# Altium schematic sheet SystemOnModule.SchDoc
size A2; CompanyName: KDS; Organization: KDS; DocumentNumber: 4; Revision: V1I1; SheetNumber: 0; SheetTotal: 10; PageSetup: Record=PageOptions|CenterHorizontal=True|CenterVertical=True|PrintScale=1.07|XCorrection=1.00|YCorrection=1.00|PrintKind=1|BorderSize=5000000|LeftOffset=0|BottomOffset=0|Orientation=2|PaperLength=1000|PaperWidth=1000|Scale=100|PaperSource=7|PrintQuality=600|MediaType=1|DitherType=10|PaperKind=A3|PrintScaleMode=1; ProjectName: KDS C6A816x Module
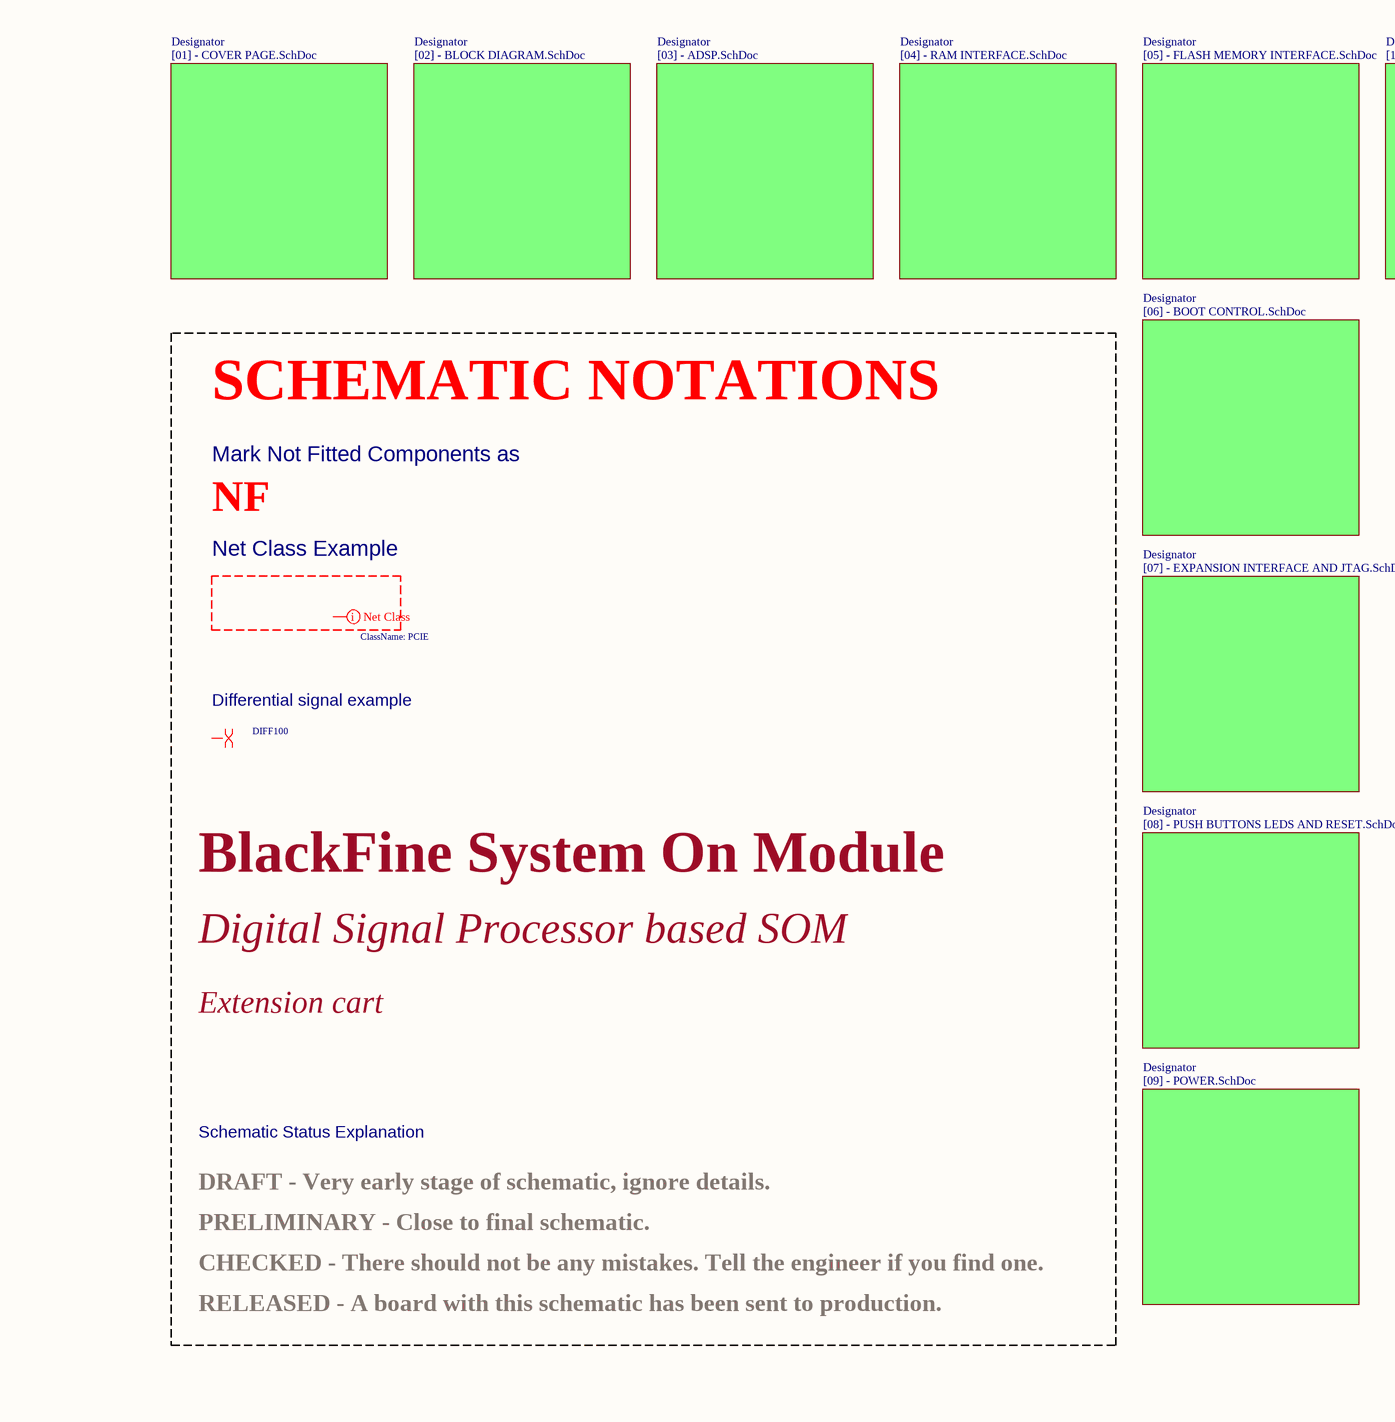
[diagram p0: SystemOnModule.SchDoc, left]
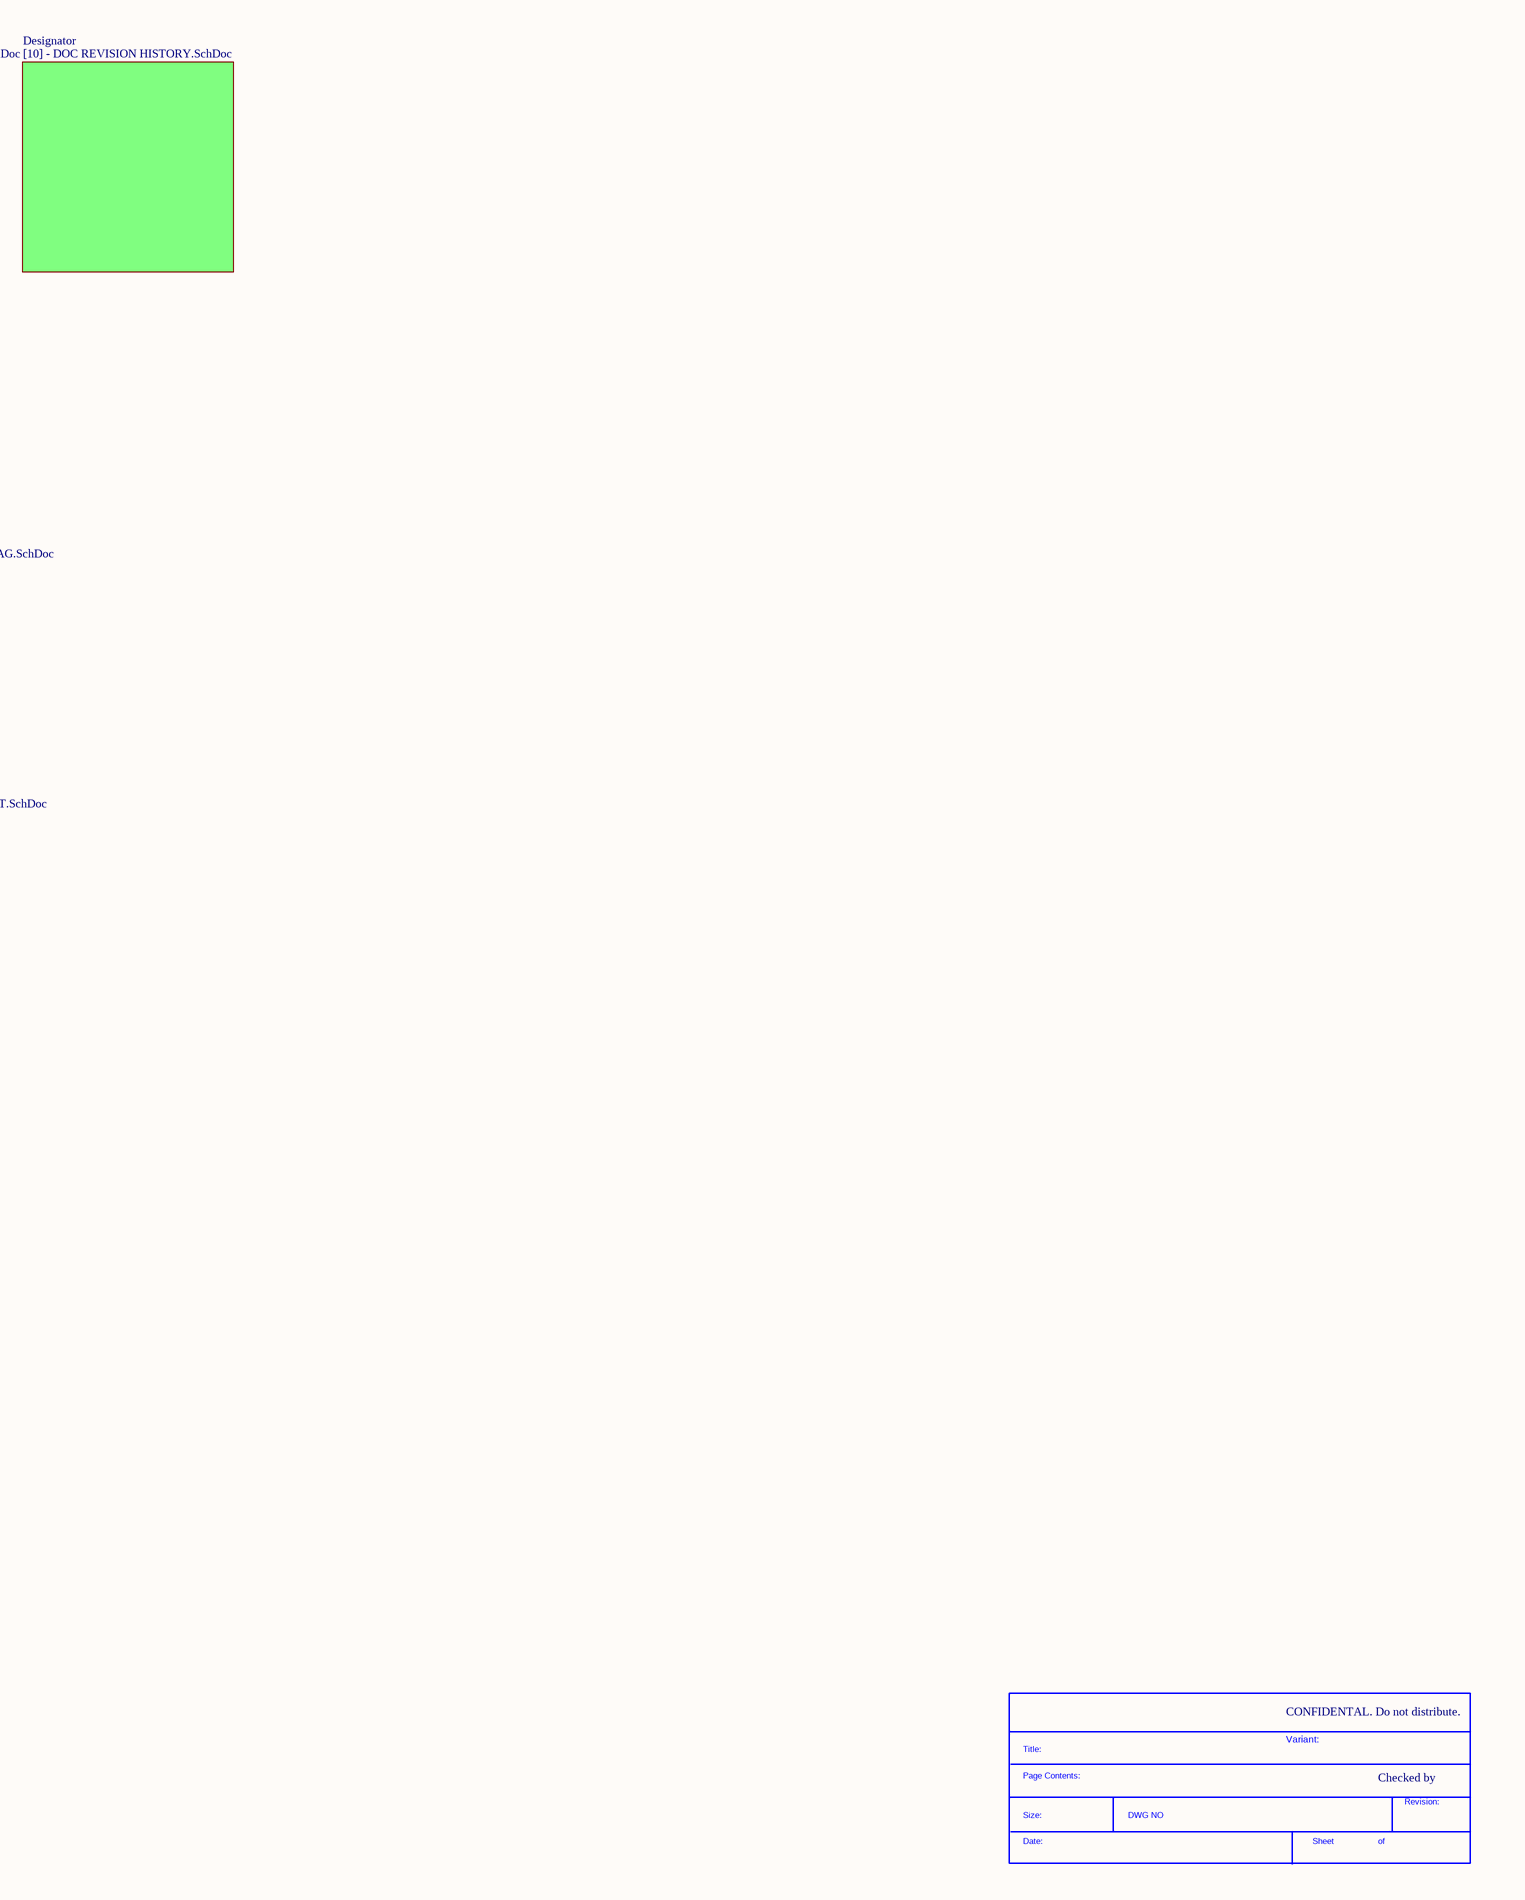
[diagram p1: SystemOnModule.SchDoc, right]

## Parts
*  SDTitleBlock  (value not drawn)  (graphical)

## Sub-sheets
Designator = [01] - COVER PAGE.SchDoc: no entries
Designator = [02] - BLOCK DIAGRAM.SchDoc: no entries
Designator = [06] - BOOT CONTROL.SchDoc: no entries
Designator = [03] - ADSP.SchDoc: no entries
Designator = [04] - RAM INTERFACE.SchDoc: no entries
Designator = [05] - FLASH MEMORY INTERFACE.SchDoc: no entries
Designator = [07] - EXPANSION INTERFACE AND JTAG.SchDoc: no entries
Designator = [08] - PUSH BUTTONS LEDS AND RESET.SchDoc: no entries
Designator = [09] - POWER.SchDoc: no entries
Designator = [10] - DOC REVISION HISTORY.SchDoc: no entries

## Layout directives
net class PCIE: (no net found under the mark)
differential pair; net class DIFF100: (no net found under the mark)

## Notes on the sheet
- SCHEMATIC NOTATIONS
- Mark Not Fitted Components as
- NF
- Net Class Example
- Differential signal example
- BlackFine System On Module
- Digital Signal Processor based SOM
- Extension cart
- Schematic Status Explanation
- PRELIMINARY - Close to final schematic.
- DRAFT - Very early stage of schematic, ignore details.
- CHECKED - There should not be any mistakes. Tell the engineer if you find one.
- RELEASED - A board with this schematic has been sent to production.
- CONFIDENTAL. Do not distribute.
- Variant:
- Checked by
- (in symbol SDTitleBlock) Title:; Page Contents:; Revision:; Size:; DWG NO; Date:; Sheet; of